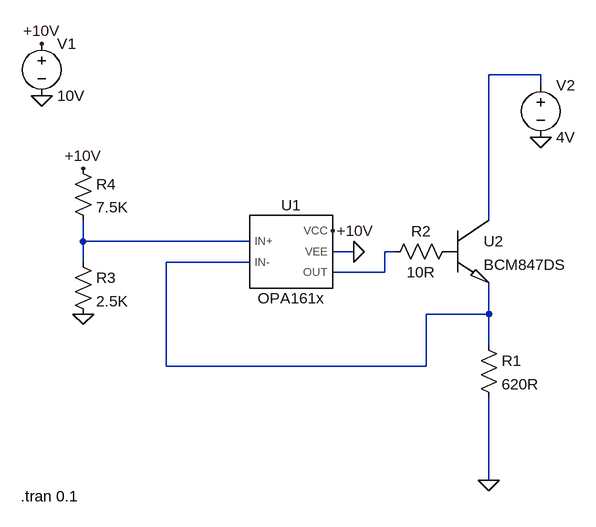
[diagram p0: schematic current_test.asc]
current_test.asc, the LTspice schematic file:
Version 4.1
SHEET 1 880 680
WIRE 560 -112 480 -112
WIRE 560 -96 560 -112
WIRE 480 112 480 -112
WIRE -144 144 -144 112
WIRE 112 144 -144 144
WIRE 272 160 240 160
WIRE 336 160 320 160
WIRE -144 176 -144 144
WIRE 112 176 -16 176
WIRE 320 192 320 160
WIRE 320 192 240 192
WIRE 480 256 480 208
WIRE 480 256 384 256
WIRE 480 304 480 256
WIRE -16 336 -16 176
WIRE 384 336 384 256
WIRE 384 336 -16 336
WIRE 480 512 480 384
FLAG 480 512 0
FLAG -208 -80 0
FLAG -208 -160 +10V
FLAG 240 128 +10V
FLAG 272 160 0
FLAG -144 256 0
FLAG -144 32 +10V
FLAG 560 -16 0
SYMBOL OPA161x 176 160 R0
SYMATTR InstName U1
SYMBOL res 464 288 R0
SYMATTR InstName R1
SYMATTR Value 620R
SYMBOL BCM847DS 416 112 R0
SYMATTR InstName U2
SYMBOL res 432 144 R90
WINDOW 0 0 56 VBottom 2
WINDOW 3 32 56 VTop 2
SYMATTR InstName R2
SYMATTR Value 10R
SYMBOL voltage -208 -176 R0
WINDOW 123 0 0 Left 0
WINDOW 39 0 0 Left 0
SYMATTR InstName V1
SYMATTR Value 10V
SYMBOL res -160 160 R0
SYMATTR InstName R3
SYMATTR Value 2.5K
SYMBOL res -160 16 R0
SYMATTR InstName R4
SYMATTR Value 7.5K
SYMBOL voltage 560 -112 R0
WINDOW 123 0 0 Left 0
WINDOW 39 0 0 Left 0
SYMATTR InstName V2
SYMATTR Value 4V
TEXT -240 536 Left 2 !.tran 0.1

The netlist it stands for:
* current_test.asc
X§U1 N002 N004 +10V 0 N003 OPA161x  ; pins IN+ IN- VCC VEE OUT
R1 N004 0 620R
X§U2 N001 P001 N004 BCM847DS  ; pins C B E
R2 P001 N003 10R
V1 +10V 0 10V
R3 N002 0 2.5K
R4 +10V N002 7.5K
V2 N001 0 4V
.tran 0.1
.lib OPA161x.LIB
.lib BCM847.lib
.backanno
.end